# Altium schematic sheet Altium_Schematic.schdoc (part 5 of 6)
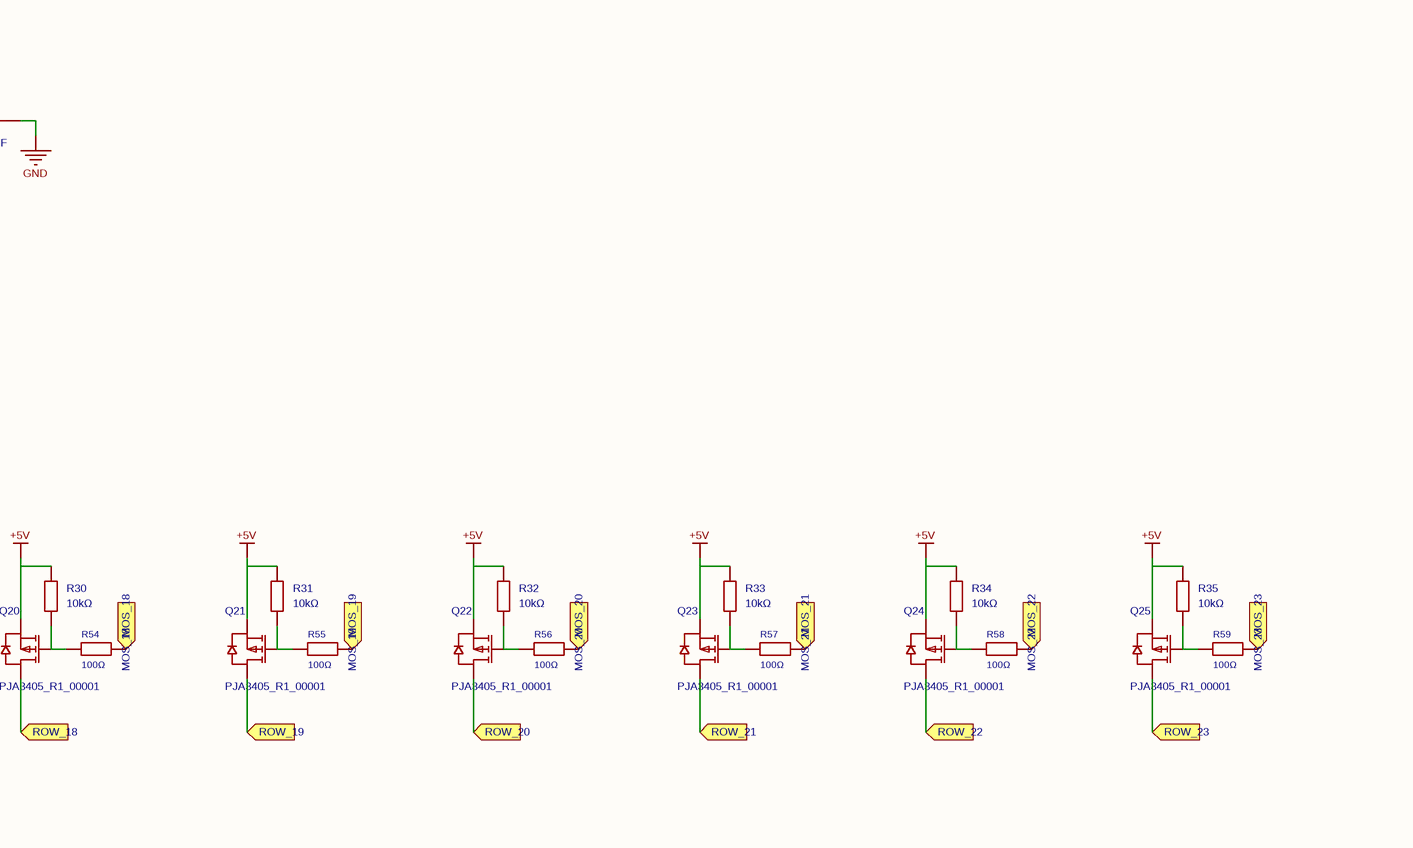
[diagram p15: Altium_Schematic.schdoc, bottom column 4 of 4]
## Nets
+3V3: C1.2 C2.1 C4.1 C5.1 C6.1 C7.1 C8.1 C9.1 C10.1 C11.1 C12.1 C13.1 C18.2 C19.2 R6.1 R7.1 R9.1 U1.24(VCC) U2.24(VCC) U3.24(VCC) U4.24(VCC) U5.24(VCC) U6.3(3V3) U10.2(VOUT) U10.4(VOUT)
+5V: C14.2 C15.2 C16.2 C17.2 C20.2 C21.2 D1.5 Q2.2(S) Q3.2(S) Q4.2(S) Q5.2(S) Q6.2(S) Q7.2(S) Q8.2(S) Q9.2(S) Q10.2(S) Q11.2(S) Q12.2(S) Q13.2(S) Q14.2(S) Q15.2(S) Q16.2(S) Q17.2(S) Q18.2(S) Q19.2(S) Q20.2(S) Q21.2(S) Q22.2(S) Q23.2(S) Q24.2(S) Q25.2(S) R8.1 R12.1 R13.1 R14.1 R15.1 R16.1 R17.1 R18.1 R19.1 R20.1 R21.1 R22.1 R23.1 R24.1 R25.1 R26.1 R27.1 R28.1 R29.1 R30.1 R31.1 R32.1 R33.1 R34.1 R35.1 U7.10(MR#) U7.16(VCC) U8.10(MR#) U8.16(VCC) U9.10(MR#) U9.16(VCC) U10.3(VIN) USB1.A4B9(VBUS) USB1.B4A9(VBUS)
GND: C1.1 C2.2 C3.1 C4.2 C5.2 C6.2 C7.2 C8.2 C9.2 C10.2 C11.2 C12.2 C13.2 C14.1 C15.1 C16.1 C17.1 C18.1 C19.1 C20.1 C21.1 D1.2 H1.3 H2.3 Q1.2(S) R1.1 R2.1 R3.1 R4.1 R5.1 R11.2 R60.1 R61.1 SW1.1 U1.1(GND) U2.1(GND) U3.1(GND) U4.1(GND) U5.1(GND) U6.1(GND) U6.2(GND) U6.11(GND) U6.14(GND) U6.36(GND) U6.37(GND) U6.38(GND) U6.39(GND) U6.40(GND) U6.41(GND) U6.42(GND) U6.43(GND) U6.44(GND) U6.45(GND) U6.46(GND) U6.47(GND) U6.48(GND) U6.49(GND) U6.50(GND) U6.51(GND) U6.52(GND) U6.53(GND) U7.8(GND) U7.17(GND) U8.8(GND) U8.17(GND) U9.8(GND) U9.17(GND) U10.1(GND) USB1.13(EH) USB1.14(EH) USB1.A1B12(GND) USB1.B1A12(GND)
COLUMN_0: U1.5(OUT0)
COLUMN_0: LED1.2(K) LED73.2(K) LED145.2(K) LED217.2(K) LED289.2(K) LED361.2(K) LED433.2(K) LED505.2(K) LED577.2(K) LED649.2(K) LED721.2(K) LED793.2(K) LED865.2(K) LED937.2(K) LED1009.2(K) LED1081.2(K) LED1153.2(K) LED1225.2(K) LED1297.2(K) LED1369.2(K) LED1441.2(K) LED1513.2(K) LED1585.2(K) LED1657.2(K) ; port COLUMN_0  [a separate net that carries the same name]
COLUMN_1: U1.6(OUT1)
COLUMN_1: LED2.2(K) LED74.2(K) LED146.2(K) LED218.2(K) LED290.2(K) LED362.2(K) LED434.2(K) LED506.2(K) LED578.2(K) LED650.2(K) LED722.2(K) LED794.2(K) LED866.2(K) LED938.2(K) LED1010.2(K) LED1082.2(K) LED1154.2(K) LED1226.2(K) LED1298.2(K) LED1370.2(K) LED1442.2(K) LED1514.2(K) LED1586.2(K) LED1658.2(K) ; port COLUMN_1  [a separate net that carries the same name]
COLUMN_2: U1.7(OUT2)
COLUMN_2: LED3.2(K) LED75.2(K) LED147.2(K) LED219.2(K) LED291.2(K) LED363.2(K) LED435.2(K) LED507.2(K) LED579.2(K) LED651.2(K) LED723.2(K) LED795.2(K) LED867.2(K) LED939.2(K) LED1011.2(K) LED1083.2(K) LED1155.2(K) LED1227.2(K) LED1299.2(K) LED1371.2(K) LED1443.2(K) LED1515.2(K) LED1587.2(K) LED1659.2(K) ; port COLUMN_2  [a separate net that carries the same name]
COLUMN_3: U1.8(OUT3)
COLUMN_3: LED4.2(K) LED76.2(K) LED148.2(K) LED220.2(K) LED292.2(K) LED364.2(K) LED436.2(K) LED508.2(K) LED580.2(K) LED652.2(K) LED724.2(K) LED796.2(K) LED868.2(K) LED940.2(K) LED1012.2(K) LED1084.2(K) LED1156.2(K) LED1228.2(K) LED1300.2(K) LED1372.2(K) LED1444.2(K) LED1516.2(K) LED1588.2(K) LED1660.2(K) ; port COLUMN_3  [a separate net that carries the same name]
COLUMN_4: U1.9(OUT4)
COLUMN_4: LED5.2(K) LED77.2(K) LED149.2(K) LED221.2(K) LED293.2(K) LED365.2(K) LED437.2(K) LED509.2(K) LED581.2(K) LED653.2(K) LED725.2(K) LED797.2(K) LED869.2(K) LED941.2(K) LED1013.2(K) LED1085.2(K) LED1157.2(K) LED1229.2(K) LED1301.2(K) LED1373.2(K) LED1445.2(K) LED1517.2(K) LED1589.2(K) LED1661.2(K) ; port COLUMN_4  [a separate net that carries the same name]
COLUMN_5: U1.10(OUT5)
COLUMN_5: LED6.2(K) LED78.2(K) LED150.2(K) LED222.2(K) LED294.2(K) LED366.2(K) LED438.2(K) LED510.2(K) LED582.2(K) LED654.2(K) LED726.2(K) LED798.2(K) LED870.2(K) LED942.2(K) LED1014.2(K) LED1086.2(K) LED1158.2(K) LED1230.2(K) LED1302.2(K) LED1374.2(K) LED1446.2(K) LED1518.2(K) LED1590.2(K) LED1662.2(K) ; port COLUMN_5  [a separate net that carries the same name]
COLUMN_6: U1.11(OUT6)
COLUMN_6: LED7.2(K) LED79.2(K) LED151.2(K) LED223.2(K) LED295.2(K) LED367.2(K) LED439.2(K) LED511.2(K) LED583.2(K) LED655.2(K) LED727.2(K) LED799.2(K) LED871.2(K) LED943.2(K) LED1015.2(K) LED1087.2(K) LED1159.2(K) LED1231.2(K) LED1303.2(K) LED1375.2(K) LED1447.2(K) LED1519.2(K) LED1591.2(K) LED1663.2(K) ; port COLUMN_6  [a separate net that carries the same name]
COLUMN_7: U1.12(OUT7)
COLUMN_7: LED8.2(K) LED80.2(K) LED152.2(K) LED224.2(K) LED296.2(K) LED368.2(K) LED440.2(K) LED512.2(K) LED584.2(K) LED656.2(K) LED728.2(K) LED800.2(K) LED872.2(K) LED944.2(K) LED1016.2(K) LED1088.2(K) LED1160.2(K) LED1232.2(K) LED1304.2(K) LED1376.2(K) LED1448.2(K) LED1520.2(K) LED1592.2(K) LED1664.2(K) ; port COLUMN_7  [a separate net that carries the same name]
COLUMN_8: U1.13(OUT8)
COLUMN_8: LED9.2(K) LED81.2(K) LED153.2(K) LED225.2(K) LED297.2(K) LED369.2(K) LED441.2(K) LED513.2(K) LED585.2(K) LED657.2(K) LED729.2(K) LED801.2(K) LED873.2(K) LED945.2(K) LED1017.2(K) LED1089.2(K) LED1161.2(K) LED1233.2(K) LED1305.2(K) LED1377.2(K) LED1449.2(K) LED1521.2(K) LED1593.2(K) LED1665.2(K) ; port COLUMN_8  [a separate net that carries the same name]
COLUMN_9: U1.14(OUT9)
COLUMN_9: LED10.2(K) LED82.2(K) LED154.2(K) LED226.2(K) LED298.2(K) LED370.2(K) LED442.2(K) LED514.2(K) LED586.2(K) LED658.2(K) LED730.2(K) LED802.2(K) LED874.2(K) LED946.2(K) LED1018.2(K) LED1090.2(K) LED1162.2(K) LED1234.2(K) LED1306.2(K) LED1378.2(K) LED1450.2(K) LED1522.2(K) LED1594.2(K) LED1666.2(K) ; port COLUMN_9  [a separate net that carries the same name]
COLUMN_10: U1.15(OUT10)
COLUMN_10: LED11.2(K) LED83.2(K) LED155.2(K) LED227.2(K) LED299.2(K) LED371.2(K) LED443.2(K) LED515.2(K) LED587.2(K) LED659.2(K) LED731.2(K) LED803.2(K) LED875.2(K) LED947.2(K) LED1019.2(K) LED1091.2(K) LED1163.2(K) LED1235.2(K) LED1307.2(K) LED1379.2(K) LED1451.2(K) LED1523.2(K) LED1595.2(K) LED1667.2(K) ; port COLUMN_10  [a separate net that carries the same name]
COLUMN_11: U1.16(OUT11)
COLUMN_11: LED12.2(K) LED84.2(K) LED156.2(K) LED228.2(K) LED300.2(K) LED372.2(K) LED444.2(K) LED516.2(K) LED588.2(K) LED660.2(K) LED732.2(K) LED804.2(K) LED876.2(K) LED948.2(K) LED1020.2(K) LED1092.2(K) LED1164.2(K) LED1236.2(K) LED1308.2(K) LED1380.2(K) LED1452.2(K) LED1524.2(K) LED1596.2(K) LED1668.2(K) ; port COLUMN_11  [a separate net that carries the same name]
COLUMN_12: U1.17(OUT12)
COLUMN_12: LED13.2(K) LED85.2(K) LED157.2(K) LED229.2(K) LED301.2(K) LED373.2(K) LED445.2(K) LED517.2(K) LED589.2(K) LED661.2(K) LED733.2(K) LED805.2(K) LED877.2(K) LED949.2(K) LED1021.2(K) LED1093.2(K) LED1165.2(K) LED1237.2(K) LED1309.2(K) LED1381.2(K) LED1453.2(K) LED1525.2(K) LED1597.2(K) LED1669.2(K) ; port COLUMN_12  [a separate net that carries the same name]
COLUMN_13: U1.18(OUT13)
COLUMN_13: LED14.2(K) LED86.2(K) LED158.2(K) LED230.2(K) LED302.2(K) LED374.2(K) LED446.2(K) LED518.2(K) LED590.2(K) LED662.2(K) LED734.2(K) LED806.2(K) LED878.2(K) LED950.2(K) LED1022.2(K) LED1094.2(K) LED1166.2(K) LED1238.2(K) LED1310.2(K) LED1382.2(K) LED1454.2(K) LED1526.2(K) LED1598.2(K) LED1670.2(K) ; port COLUMN_13  [a separate net that carries the same name]
COLUMN_14: U1.19(OUT14)
COLUMN_14: LED15.2(K) LED87.2(K) LED159.2(K) LED231.2(K) LED303.2(K) LED375.2(K) LED447.2(K) LED519.2(K) LED591.2(K) LED663.2(K) LED735.2(K) LED807.2(K) LED879.2(K) LED951.2(K) LED1023.2(K) LED1095.2(K) LED1167.2(K) LED1239.2(K) LED1311.2(K) LED1383.2(K) LED1455.2(K) LED1527.2(K) LED1599.2(K) LED1671.2(K) ; port COLUMN_14  [a separate net that carries the same name]
COLUMN_15: U1.20(OUT15)
COLUMN_15: LED16.2(K) LED88.2(K) LED160.2(K) LED232.2(K) LED304.2(K) LED376.2(K) LED448.2(K) LED520.2(K) LED592.2(K) LED664.2(K) LED736.2(K) LED808.2(K) LED880.2(K) LED952.2(K) LED1024.2(K) LED1096.2(K) LED1168.2(K) LED1240.2(K) LED1312.2(K) LED1384.2(K) LED1456.2(K) LED1528.2(K) LED1600.2(K) LED1672.2(K) ; port COLUMN_15  [a separate net that carries the same name]
COLUMN_16: U2.5(OUT0)
COLUMN_16: LED17.2(K) LED89.2(K) LED161.2(K) LED233.2(K) LED305.2(K) LED377.2(K) LED449.2(K) LED521.2(K) LED593.2(K) LED665.2(K) LED737.2(K) LED809.2(K) LED881.2(K) LED953.2(K) LED1025.2(K) LED1097.2(K) LED1169.2(K) LED1241.2(K) LED1313.2(K) LED1385.2(K) LED1457.2(K) LED1529.2(K) LED1601.2(K) LED1673.2(K) ; port COLUMN_16  [a separate net that carries the same name]
COLUMN_17: U2.6(OUT1)
COLUMN_17: LED18.2(K) LED90.2(K) LED162.2(K) LED234.2(K) LED306.2(K) LED378.2(K) LED450.2(K) LED522.2(K) LED594.2(K) LED666.2(K) LED738.2(K) LED810.2(K) LED882.2(K) LED954.2(K) LED1026.2(K) LED1098.2(K) LED1170.2(K) LED1242.2(K) LED1314.2(K) LED1386.2(K) LED1458.2(K) LED1530.2(K) LED1602.2(K) LED1674.2(K) ; port COLUMN_17  [a separate net that carries the same name]
COLUMN_18: U2.7(OUT2)
COLUMN_18: LED19.2(K) LED91.2(K) LED163.2(K) LED235.2(K) LED307.2(K) LED379.2(K) LED451.2(K) LED523.2(K) LED595.2(K) LED667.2(K) LED739.2(K) LED811.2(K) LED883.2(K) LED955.2(K) LED1027.2(K) LED1099.2(K) LED1171.2(K) LED1243.2(K) LED1315.2(K) LED1387.2(K) LED1459.2(K) LED1531.2(K) LED1603.2(K) LED1675.2(K) ; port COLUMN_18  [a separate net that carries the same name]
COLUMN_19: U2.8(OUT3)
COLUMN_19: LED20.2(K) LED92.2(K) LED164.2(K) LED236.2(K) LED308.2(K) LED380.2(K) LED452.2(K) LED524.2(K) LED596.2(K) LED668.2(K) LED740.2(K) LED812.2(K) LED884.2(K) LED956.2(K) LED1028.2(K) LED1100.2(K) LED1172.2(K) LED1244.2(K) LED1316.2(K) LED1388.2(K) LED1460.2(K) LED1532.2(K) LED1604.2(K) LED1676.2(K) ; port COLUMN_19  [a separate net that carries the same name]
COLUMN_20: U2.9(OUT4)
COLUMN_20: LED21.2(K) LED93.2(K) LED165.2(K) LED237.2(K) LED309.2(K) LED381.2(K) LED453.2(K) LED525.2(K) LED597.2(K) LED669.2(K) LED741.2(K) LED813.2(K) LED885.2(K) LED957.2(K) LED1029.2(K) LED1101.2(K) LED1173.2(K) LED1245.2(K) LED1317.2(K) LED1389.2(K) LED1461.2(K) LED1533.2(K) LED1605.2(K) LED1677.2(K) ; port COLUMN_20  [a separate net that carries the same name]
COLUMN_21: U2.10(OUT5)
COLUMN_21: LED22.2(K) LED94.2(K) LED166.2(K) LED238.2(K) LED310.2(K) LED382.2(K) LED454.2(K) LED526.2(K) LED598.2(K) LED670.2(K) LED742.2(K) LED814.2(K) LED886.2(K) LED958.2(K) LED1030.2(K) LED1102.2(K) LED1174.2(K) LED1246.2(K) LED1318.2(K) LED1390.2(K) LED1462.2(K) LED1534.2(K) LED1606.2(K) LED1678.2(K) ; port COLUMN_21  [a separate net that carries the same name]
COLUMN_22: U2.11(OUT6)
COLUMN_22: LED23.2(K) LED95.2(K) LED167.2(K) LED239.2(K) LED311.2(K) LED383.2(K) LED455.2(K) LED527.2(K) LED599.2(K) LED671.2(K) LED743.2(K) LED815.2(K) LED887.2(K) LED959.2(K) LED1031.2(K) LED1103.2(K) LED1175.2(K) LED1247.2(K) LED1319.2(K) LED1391.2(K) LED1463.2(K) LED1535.2(K) LED1607.2(K) LED1679.2(K) ; port COLUMN_22  [a separate net that carries the same name]
COLUMN_23: U2.12(OUT7)
COLUMN_23: LED24.2(K) LED96.2(K) LED168.2(K) LED240.2(K) LED312.2(K) LED384.2(K) LED456.2(K) LED528.2(K) LED600.2(K) LED672.2(K) LED744.2(K) LED816.2(K) LED888.2(K) LED960.2(K) LED1032.2(K) LED1104.2(K) LED1176.2(K) LED1248.2(K) LED1320.2(K) LED1392.2(K) LED1464.2(K) LED1536.2(K) LED1608.2(K) LED1680.2(K) ; port COLUMN_23  [a separate net that carries the same name]
COLUMN_24: U2.13(OUT8)
COLUMN_24: LED25.2(K) LED97.2(K) LED169.2(K) LED241.2(K) LED313.2(K) LED385.2(K) LED457.2(K) LED529.2(K) LED601.2(K) LED673.2(K) LED745.2(K) LED817.2(K) LED889.2(K) LED961.2(K) LED1033.2(K) LED1105.2(K) LED1177.2(K) LED1249.2(K) LED1321.2(K) LED1393.2(K) LED1465.2(K) LED1537.2(K) LED1609.2(K) LED1681.2(K) ; port COLUMN_24  [a separate net that carries the same name]
COLUMN_25: U2.14(OUT9)
COLUMN_25: LED26.2(K) LED98.2(K) LED170.2(K) LED242.2(K) LED314.2(K) LED386.2(K) LED458.2(K) LED530.2(K) LED602.2(K) LED674.2(K) LED746.2(K) LED818.2(K) LED890.2(K) LED962.2(K) LED1034.2(K) LED1106.2(K) LED1178.2(K) LED1250.2(K) LED1322.2(K) LED1394.2(K) LED1466.2(K) LED1538.2(K) LED1610.2(K) LED1682.2(K) ; port COLUMN_25  [a separate net that carries the same name]
COLUMN_26: U2.15(OUT10)
COLUMN_26: LED27.2(K) LED99.2(K) LED171.2(K) LED243.2(K) LED315.2(K) LED387.2(K) LED459.2(K) LED531.2(K) LED603.2(K) LED675.2(K) LED747.2(K) LED819.2(K) LED891.2(K) LED963.2(K) LED1035.2(K) LED1107.2(K) LED1179.2(K) LED1251.2(K) LED1323.2(K) LED1395.2(K) LED1467.2(K) LED1539.2(K) LED1611.2(K) LED1683.2(K) ; port COLUMN_26  [a separate net that carries the same name]
COLUMN_27: U2.16(OUT11)
COLUMN_27: LED28.2(K) LED100.2(K) LED172.2(K) LED244.2(K) LED316.2(K) LED388.2(K) LED460.2(K) LED532.2(K) LED604.2(K) LED676.2(K) LED748.2(K) LED820.2(K) LED892.2(K) LED964.2(K) LED1036.2(K) LED1108.2(K) LED1180.2(K) LED1252.2(K) LED1324.2(K) LED1396.2(K) LED1468.2(K) LED1540.2(K) LED1612.2(K) LED1684.2(K) ; port COLUMN_27  [a separate net that carries the same name]
COLUMN_28: U2.17(OUT12)
COLUMN_28: LED29.2(K) LED101.2(K) LED173.2(K) LED245.2(K) LED317.2(K) LED389.2(K) LED461.2(K) LED533.2(K) LED605.2(K) LED677.2(K) LED749.2(K) LED821.2(K) LED893.2(K) LED965.2(K) LED1037.2(K) LED1109.2(K) LED1181.2(K) LED1253.2(K) LED1325.2(K) LED1397.2(K) LED1469.2(K) LED1541.2(K) LED1613.2(K) LED1685.2(K) ; port COLUMN_28  [a separate net that carries the same name]
COLUMN_29: U2.18(OUT13)
COLUMN_29: LED30.2(K) LED102.2(K) LED174.2(K) LED246.2(K) LED318.2(K) LED390.2(K) LED462.2(K) LED534.2(K) LED606.2(K) LED678.2(K) LED750.2(K) LED822.2(K) LED894.2(K) LED966.2(K) LED1038.2(K) LED1110.2(K) LED1182.2(K) LED1254.2(K) LED1326.2(K) LED1398.2(K) LED1470.2(K) LED1542.2(K) LED1614.2(K) LED1686.2(K) ; port COLUMN_29  [a separate net that carries the same name]
COLUMN_30: U2.19(OUT14)
COLUMN_30: LED31.2(K) LED103.2(K) LED175.2(K) LED247.2(K) LED319.2(K) LED391.2(K) LED463.2(K) LED535.2(K) LED607.2(K) LED679.2(K) LED751.2(K) LED823.2(K) LED895.2(K) LED967.2(K) LED1039.2(K) LED1111.2(K) LED1183.2(K) LED1255.2(K) LED1327.2(K) LED1399.2(K) LED1471.2(K) LED1543.2(K) LED1615.2(K) LED1687.2(K) ; port COLUMN_30  [a separate net that carries the same name]
COLUMN_31: U2.20(OUT15)
COLUMN_31: LED32.2(K) LED104.2(K) LED176.2(K) LED248.2(K) LED320.2(K) LED392.2(K) LED464.2(K) LED536.2(K) LED608.2(K) LED680.2(K) LED752.2(K) LED824.2(K) LED896.2(K) LED968.2(K) LED1040.2(K) LED1112.2(K) LED1184.2(K) LED1256.2(K) LED1328.2(K) LED1400.2(K) LED1472.2(K) LED1544.2(K) LED1616.2(K) LED1688.2(K) ; port COLUMN_31  [a separate net that carries the same name]
COLUMN_32: U3.5(OUT0)
COLUMN_32: LED33.2(K) LED105.2(K) LED177.2(K) LED249.2(K) LED321.2(K) LED393.2(K) LED465.2(K) LED537.2(K) LED609.2(K) LED681.2(K) LED753.2(K) LED825.2(K) LED897.2(K) LED969.2(K) LED1041.2(K) LED1113.2(K) LED1185.2(K) LED1257.2(K) LED1329.2(K) LED1401.2(K) LED1473.2(K) LED1545.2(K) LED1617.2(K) LED1689.2(K) ; port COLUMN_32  [a separate net that carries the same name]
COLUMN_33: U3.6(OUT1)
COLUMN_33: LED34.2(K) LED106.2(K) LED178.2(K) LED250.2(K) LED322.2(K) LED394.2(K) LED466.2(K) LED538.2(K) LED610.2(K) LED682.2(K) LED754.2(K) LED826.2(K) LED898.2(K) LED970.2(K) LED1042.2(K) LED1114.2(K) LED1186.2(K) LED1258.2(K) LED1330.2(K) LED1402.2(K) LED1474.2(K) LED1546.2(K) LED1618.2(K) LED1690.2(K) ; port COLUMN_33  [a separate net that carries the same name]
COLUMN_34: U3.7(OUT2)
COLUMN_34: LED35.2(K) LED107.2(K) LED179.2(K) LED251.2(K) LED323.2(K) LED395.2(K) LED467.2(K) LED539.2(K) LED611.2(K) LED683.2(K) LED755.2(K) LED827.2(K) LED899.2(K) LED971.2(K) LED1043.2(K) LED1115.2(K) LED1187.2(K) LED1259.2(K) LED1331.2(K) LED1403.2(K) LED1475.2(K) LED1547.2(K) LED1619.2(K) LED1691.2(K) ; port COLUMN_34  [a separate net that carries the same name]
COLUMN_35: U3.8(OUT3)
COLUMN_35: LED36.2(K) LED108.2(K) LED180.2(K) LED252.2(K) LED324.2(K) LED396.2(K) LED468.2(K) LED540.2(K) LED612.2(K) LED684.2(K) LED756.2(K) LED828.2(K) LED900.2(K) LED972.2(K) LED1044.2(K) LED1116.2(K) LED1188.2(K) LED1260.2(K) LED1332.2(K) LED1404.2(K) LED1476.2(K) LED1548.2(K) LED1620.2(K) LED1692.2(K) ; port COLUMN_35  [a separate net that carries the same name]
COLUMN_36: U3.9(OUT4)
COLUMN_36: LED37.2(K) LED109.2(K) LED181.2(K) LED253.2(K) LED325.2(K) LED397.2(K) LED469.2(K) LED541.2(K) LED613.2(K) LED685.2(K) LED757.2(K) LED829.2(K) LED901.2(K) LED973.2(K) LED1045.2(K) LED1117.2(K) LED1189.2(K) LED1261.2(K) LED1333.2(K) LED1405.2(K) LED1477.2(K) LED1549.2(K) LED1621.2(K) LED1693.2(K) ; port COLUMN_36  [a separate net that carries the same name]
COLUMN_37: U3.10(OUT5)
COLUMN_37: LED38.2(K) LED110.2(K) LED182.2(K) LED254.2(K) LED326.2(K) LED398.2(K) LED470.2(K) LED542.2(K) LED614.2(K) LED686.2(K) LED758.2(K) LED830.2(K) LED902.2(K) LED974.2(K) LED1046.2(K) LED1118.2(K) LED1190.2(K) LED1262.2(K) LED1334.2(K) LED1406.2(K) LED1478.2(K) LED1550.2(K) LED1622.2(K) LED1694.2(K) ; port COLUMN_37  [a separate net that carries the same name]
COLUMN_38: U3.11(OUT6)
COLUMN_38: LED39.2(K) LED111.2(K) LED183.2(K) LED255.2(K) LED327.2(K) LED399.2(K) LED471.2(K) LED543.2(K) LED615.2(K) LED687.2(K) LED759.2(K) LED831.2(K) LED903.2(K) LED975.2(K) LED1047.2(K) LED1119.2(K) LED1191.2(K) LED1263.2(K) LED1335.2(K) LED1407.2(K) LED1479.2(K) LED1551.2(K) LED1623.2(K) LED1695.2(K) ; port COLUMN_38  [a separate net that carries the same name]
COLUMN_39: U3.12(OUT7)
COLUMN_39: LED40.2(K) LED112.2(K) LED184.2(K) LED256.2(K) LED328.2(K) LED400.2(K) LED472.2(K) LED544.2(K) LED616.2(K) LED688.2(K) LED760.2(K) LED832.2(K) LED904.2(K) LED976.2(K) LED1048.2(K) LED1120.2(K) LED1192.2(K) LED1264.2(K) LED1336.2(K) LED1408.2(K) LED1480.2(K) LED1552.2(K) LED1624.2(K) LED1696.2(K) ; port COLUMN_39  [a separate net that carries the same name]
COLUMN_40: U3.13(OUT8)
COLUMN_40: LED41.2(K) LED113.2(K) LED185.2(K) LED257.2(K) LED329.2(K) LED401.2(K) LED473.2(K) LED545.2(K) LED617.2(K) LED689.2(K) LED761.2(K) LED833.2(K) LED905.2(K) LED977.2(K) LED1049.2(K) LED1121.2(K) LED1193.2(K) LED1265.2(K) LED1337.2(K) LED1409.2(K) LED1481.2(K) LED1553.2(K) LED1625.2(K) LED1697.2(K) ; port COLUMN_40  [a separate net that carries the same name]
COLUMN_41: U3.14(OUT9)
COLUMN_41: LED42.2(K) LED114.2(K) LED186.2(K) LED258.2(K) LED330.2(K) LED402.2(K) LED474.2(K) LED546.2(K) LED618.2(K) LED690.2(K) LED762.2(K) LED834.2(K) LED906.2(K) LED978.2(K) LED1050.2(K) LED1122.2(K) LED1194.2(K) LED1266.2(K) LED1338.2(K) LED1410.2(K) LED1482.2(K) LED1554.2(K) LED1626.2(K) LED1698.2(K) ; port COLUMN_41  [a separate net that carries the same name]
COLUMN_42: U3.15(OUT10)
COLUMN_42: LED43.2(K) LED115.2(K) LED187.2(K) LED259.2(K) LED331.2(K) LED403.2(K) LED475.2(K) LED547.2(K) LED619.2(K) LED691.2(K) LED763.2(K) LED835.2(K) LED907.2(K) LED979.2(K) LED1051.2(K) LED1123.2(K) LED1195.2(K) LED1267.2(K) LED1339.2(K) LED1411.2(K) LED1483.2(K) LED1555.2(K) LED1627.2(K) LED1699.2(K) ; port COLUMN_42  [a separate net that carries the same name]
COLUMN_43: U3.16(OUT11)
COLUMN_43: LED44.2(K) LED116.2(K) LED188.2(K) LED260.2(K) LED332.2(K) LED404.2(K) LED476.2(K) LED548.2(K) LED620.2(K) LED692.2(K) LED764.2(K) LED836.2(K) LED908.2(K) LED980.2(K) LED1052.2(K) LED1124.2(K) LED1196.2(K) LED1268.2(K) LED1340.2(K) LED1412.2(K) LED1484.2(K) LED1556.2(K) LED1628.2(K) LED1700.2(K) ; port COLUMN_43  [a separate net that carries the same name]
COLUMN_44: U3.17(OUT12)
COLUMN_44: LED45.2(K) LED117.2(K) LED189.2(K) LED261.2(K) LED333.2(K) LED405.2(K) LED477.2(K) LED549.2(K) LED621.2(K) LED693.2(K) LED765.2(K) LED837.2(K) LED909.2(K) LED981.2(K) LED1053.2(K) LED1125.2(K) LED1197.2(K) LED1269.2(K) LED1341.2(K) LED1413.2(K) LED1485.2(K) LED1557.2(K) LED1629.2(K) LED1701.2(K) ; port COLUMN_44  [a separate net that carries the same name]
COLUMN_45: U3.18(OUT13)
COLUMN_45: LED46.2(K) LED118.2(K) LED190.2(K) LED262.2(K) LED334.2(K) LED406.2(K) LED478.2(K) LED550.2(K) LED622.2(K) LED694.2(K) LED766.2(K) LED838.2(K) LED910.2(K) LED982.2(K) LED1054.2(K) LED1126.2(K) LED1198.2(K) LED1270.2(K) LED1342.2(K) LED1414.2(K) LED1486.2(K) LED1558.2(K) LED1630.2(K) LED1702.2(K) ; port COLUMN_45  [a separate net that carries the same name]
COLUMN_46: U3.19(OUT14)
COLUMN_46: LED47.2(K) LED119.2(K) LED191.2(K) LED263.2(K) LED335.2(K) LED407.2(K) LED479.2(K) LED551.2(K) LED623.2(K) LED695.2(K) LED767.2(K) LED839.2(K) LED911.2(K) LED983.2(K) LED1055.2(K) LED1127.2(K) LED1199.2(K) LED1271.2(K) LED1343.2(K) LED1415.2(K) LED1487.2(K) LED1559.2(K) LED1631.2(K) LED1703.2(K) ; port COLUMN_46  [a separate net that carries the same name]
COLUMN_47: U3.20(OUT15)
COLUMN_47: LED48.2(K) LED120.2(K) LED192.2(K) LED264.2(K) LED336.2(K) LED408.2(K) LED480.2(K) LED552.2(K) LED624.2(K) LED696.2(K) LED768.2(K) LED840.2(K) LED912.2(K) LED984.2(K) LED1056.2(K) LED1128.2(K) LED1200.2(K) LED1272.2(K) LED1344.2(K) LED1416.2(K) LED1488.2(K) LED1560.2(K) LED1632.2(K) LED1704.2(K) ; port COLUMN_47  [a separate net that carries the same name]
COLUMN_48: U4.5(OUT0)
COLUMN_48: LED49.2(K) LED121.2(K) LED193.2(K) LED265.2(K) LED337.2(K) LED409.2(K) LED481.2(K) LED553.2(K) LED625.2(K) LED697.2(K) LED769.2(K) LED841.2(K) LED913.2(K) LED985.2(K) LED1057.2(K) LED1129.2(K) LED1201.2(K) LED1273.2(K) LED1345.2(K) LED1417.2(K) LED1489.2(K) LED1561.2(K) LED1633.2(K) LED1705.2(K) ; port COLUMN_48  [a separate net that carries the same name]
COLUMN_49: U4.6(OUT1)
COLUMN_49: LED50.2(K) LED122.2(K) LED194.2(K) LED266.2(K) LED338.2(K) LED410.2(K) LED482.2(K) LED554.2(K) LED626.2(K) LED698.2(K) LED770.2(K) LED842.2(K) LED914.2(K) LED986.2(K) LED1058.2(K) LED1130.2(K) LED1202.2(K) LED1274.2(K) LED1346.2(K) LED1418.2(K) LED1490.2(K) LED1562.2(K) LED1634.2(K) LED1706.2(K) ; port COLUMN_49  [a separate net that carries the same name]
COLUMN_50: U4.7(OUT2)
COLUMN_50: LED51.2(K) LED123.2(K) LED195.2(K) LED267.2(K) LED339.2(K) LED411.2(K) LED483.2(K) LED555.2(K) LED627.2(K) LED699.2(K) LED771.2(K) LED843.2(K) LED915.2(K) LED987.2(K) LED1059.2(K) LED1131.2(K) LED1203.2(K) LED1275.2(K) LED1347.2(K) LED1419.2(K) LED1491.2(K) LED1563.2(K) LED1635.2(K) LED1707.2(K) ; port COLUMN_50  [a separate net that carries the same name]
COLUMN_51: U4.8(OUT3)
COLUMN_51: LED52.2(K) LED124.2(K) LED196.2(K) LED268.2(K) LED340.2(K) LED412.2(K) LED484.2(K) LED556.2(K) LED628.2(K) LED700.2(K) LED772.2(K) LED844.2(K) LED916.2(K) LED988.2(K) LED1060.2(K) LED1132.2(K) LED1204.2(K) LED1276.2(K) LED1348.2(K) LED1420.2(K) LED1492.2(K) LED1564.2(K) LED1636.2(K) LED1708.2(K) ; port COLUMN_51  [a separate net that carries the same name]
COLUMN_52: U4.9(OUT4)
COLUMN_52: LED53.2(K) LED125.2(K) LED197.2(K) LED269.2(K) LED341.2(K) LED413.2(K) LED485.2(K) LED557.2(K) LED629.2(K) LED701.2(K) LED773.2(K) LED845.2(K) LED917.2(K) LED989.2(K) LED1061.2(K) LED1133.2(K) LED1205.2(K) LED1277.2(K) LED1349.2(K) LED1421.2(K) LED1493.2(K) LED1565.2(K) LED1637.2(K) LED1709.2(K) ; port COLUMN_52  [a separate net that carries the same name]
COLUMN_53: U4.10(OUT5)
COLUMN_53: LED54.2(K) LED126.2(K) LED198.2(K) LED270.2(K) LED342.2(K) LED414.2(K) LED486.2(K) LED558.2(K) LED630.2(K) LED702.2(K) LED774.2(K) LED846.2(K) LED918.2(K) LED990.2(K) LED1062.2(K) LED1134.2(K) LED1206.2(K) LED1278.2(K) LED1350.2(K) LED1422.2(K) LED1494.2(K) LED1566.2(K) LED1638.2(K) LED1710.2(K) ; port COLUMN_53  [a separate net that carries the same name]
COLUMN_54: U4.11(OUT6)
COLUMN_54: LED55.2(K) LED127.2(K) LED199.2(K) LED271.2(K) LED343.2(K) LED415.2(K) LED487.2(K) LED559.2(K) LED631.2(K) LED703.2(K) LED775.2(K) LED847.2(K) LED919.2(K) LED991.2(K) LED1063.2(K) LED1135.2(K) LED1207.2(K) LED1279.2(K) LED1351.2(K) LED1423.2(K) LED1495.2(K) LED1567.2(K) LED1639.2(K) LED1711.2(K) ; port COLUMN_54  [a separate net that carries the same name]
COLUMN_55: U4.12(OUT7)
COLUMN_55: LED56.2(K) LED128.2(K) LED200.2(K) LED272.2(K) LED344.2(K) LED416.2(K) LED488.2(K) LED560.2(K) LED632.2(K) LED704.2(K) LED776.2(K) LED848.2(K) LED920.2(K) LED992.2(K) LED1064.2(K) LED1136.2(K) LED1208.2(K) LED1280.2(K) LED1352.2(K) LED1424.2(K) LED1496.2(K) LED1568.2(K) LED1640.2(K) LED1712.2(K) ; port COLUMN_55  [a separate net that carries the same name]
COLUMN_56: U4.13(OUT8)
COLUMN_56: LED57.2(K) LED129.2(K) LED201.2(K) LED273.2(K) LED345.2(K) LED417.2(K) LED489.2(K) LED561.2(K) LED633.2(K) LED705.2(K) LED777.2(K) LED849.2(K) LED921.2(K) LED993.2(K) LED1065.2(K) LED1137.2(K) LED1209.2(K) LED1281.2(K) LED1353.2(K) LED1425.2(K) LED1497.2(K) LED1569.2(K) LED1641.2(K) LED1713.2(K) ; port COLUMN_56  [a separate net that carries the same name]
COLUMN_57: U4.14(OUT9)
COLUMN_57: LED58.2(K) LED130.2(K) LED202.2(K) LED274.2(K) LED346.2(K) LED418.2(K) LED490.2(K) LED562.2(K) LED634.2(K) LED706.2(K) LED778.2(K) LED850.2(K) LED922.2(K) LED994.2(K) LED1066.2(K) LED1138.2(K) LED1210.2(K) LED1282.2(K) LED1354.2(K) LED1426.2(K) LED1498.2(K) LED1570.2(K) LED1642.2(K) LED1714.2(K) ; port COLUMN_57  [a separate net that carries the same name]
COLUMN_58: U4.15(OUT10)
COLUMN_58: LED59.2(K) LED131.2(K) LED203.2(K) LED275.2(K) LED347.2(K) LED419.2(K) LED491.2(K) LED563.2(K) LED635.2(K) LED707.2(K) LED779.2(K) LED851.2(K) LED923.2(K) LED995.2(K) LED1067.2(K) LED1139.2(K) LED1211.2(K) LED1283.2(K) LED1355.2(K) LED1427.2(K) LED1499.2(K) LED1571.2(K) LED1643.2(K) LED1715.2(K) ; port COLUMN_58  [a separate net that carries the same name]
COLUMN_59: U4.16(OUT11)
COLUMN_59: LED60.2(K) LED132.2(K) LED204.2(K) LED276.2(K) LED348.2(K) LED420.2(K) LED492.2(K) LED564.2(K) LED636.2(K) LED708.2(K) LED780.2(K) LED852.2(K) LED924.2(K) LED996.2(K) LED1068.2(K) LED1140.2(K) LED1212.2(K) LED1284.2(K) LED1356.2(K) LED1428.2(K) LED1500.2(K) LED1572.2(K) LED1644.2(K) LED1716.2(K) ; port COLUMN_59  [a separate net that carries the same name]
COLUMN_60: U4.17(OUT12)
COLUMN_60: LED61.2(K) LED133.2(K) LED205.2(K) LED277.2(K) LED349.2(K) LED421.2(K) LED493.2(K) LED565.2(K) LED637.2(K) LED709.2(K) LED781.2(K) LED853.2(K) LED925.2(K) LED997.2(K) LED1069.2(K) LED1141.2(K) LED1213.2(K) LED1285.2(K) LED1357.2(K) LED1429.2(K) LED1501.2(K) LED1573.2(K) LED1645.2(K) LED1717.2(K) ; port COLUMN_60  [a separate net that carries the same name]
COLUMN_61: U4.18(OUT13)
COLUMN_61: LED62.2(K) LED134.2(K) LED206.2(K) LED278.2(K) LED350.2(K) LED422.2(K) LED494.2(K) LED566.2(K) LED638.2(K) LED710.2(K) LED782.2(K) LED854.2(K) LED926.2(K) LED998.2(K) LED1070.2(K) LED1142.2(K) LED1214.2(K) LED1286.2(K) LED1358.2(K) LED1430.2(K) LED1502.2(K) LED1574.2(K) LED1646.2(K) LED1718.2(K) ; port COLUMN_61  [a separate net that carries the same name]
COLUMN_62: U4.19(OUT14)
COLUMN_62: LED63.2(K) LED135.2(K) LED207.2(K) LED279.2(K) LED351.2(K) LED423.2(K) LED495.2(K) LED567.2(K) LED639.2(K) LED711.2(K) LED783.2(K) LED855.2(K) LED927.2(K) LED999.2(K) LED1071.2(K) LED1143.2(K) LED1215.2(K) LED1287.2(K) LED1359.2(K) LED1431.2(K) LED1503.2(K) LED1575.2(K) LED1647.2(K) LED1719.2(K) ; port COLUMN_62  [a separate net that carries the same name]
COLUMN_63: U4.20(OUT15)
COLUMN_63: LED64.2(K) LED136.2(K) LED208.2(K) LED280.2(K) LED352.2(K) LED424.2(K) LED496.2(K) LED568.2(K) LED640.2(K) LED712.2(K) LED784.2(K) LED856.2(K) LED928.2(K) LED1000.2(K) LED1072.2(K) LED1144.2(K) LED1216.2(K) LED1288.2(K) LED1360.2(K) LED1432.2(K) LED1504.2(K) LED1576.2(K) LED1648.2(K) LED1720.2(K) ; port COLUMN_63  [a separate net that carries the same name]
COLUMN_64: U5.5(OUT0)
COLUMN_64: LED65.2(K) LED137.2(K) LED209.2(K) LED281.2(K) LED353.2(K) LED425.2(K) LED497.2(K) LED569.2(K) LED641.2(K) LED713.2(K) LED785.2(K) LED857.2(K) LED929.2(K) LED1001.2(K) LED1073.2(K) LED1145.2(K) LED1217.2(K) LED1289.2(K) LED1361.2(K) LED1433.2(K) LED1505.2(K) LED1577.2(K) LED1649.2(K) LED1721.2(K) ; port COLUMN_64  [a separate net that carries the same name]
COLUMN_65: U5.6(OUT1)
COLUMN_65: LED66.2(K) LED138.2(K) LED210.2(K) LED282.2(K) LED354.2(K) LED426.2(K) LED498.2(K) LED570.2(K) LED642.2(K) LED714.2(K) LED786.2(K) LED858.2(K) LED930.2(K) LED1002.2(K) LED1074.2(K) LED1146.2(K) LED1218.2(K) LED1290.2(K) LED1362.2(K) LED1434.2(K) LED1506.2(K) LED1578.2(K) LED1650.2(K) LED1722.2(K) ; port COLUMN_65  [a separate net that carries the same name]
COLUMN_66: U5.7(OUT2)
COLUMN_66: LED67.2(K) LED139.2(K) LED211.2(K) LED283.2(K) LED355.2(K) LED427.2(K) LED499.2(K) LED571.2(K) LED643.2(K) LED715.2(K) LED787.2(K) LED859.2(K) LED931.2(K) LED1003.2(K) LED1075.2(K) LED1147.2(K) LED1219.2(K) LED1291.2(K) LED1363.2(K) LED1435.2(K) LED1507.2(K) LED1579.2(K) LED1651.2(K) LED1723.2(K) ; port COLUMN_66  [a separate net that carries the same name]
COLUMN_67: U5.8(OUT3)
COLUMN_67: LED68.2(K) LED140.2(K) LED212.2(K) LED284.2(K) LED356.2(K) LED428.2(K) LED500.2(K) LED572.2(K) LED644.2(K) LED716.2(K) LED788.2(K) LED860.2(K) LED932.2(K) LED1004.2(K) LED1076.2(K) LED1148.2(K) LED1220.2(K) LED1292.2(K) LED1364.2(K) LED1436.2(K) LED1508.2(K) LED1580.2(K) LED1652.2(K) LED1724.2(K) ; port COLUMN_67  [a separate net that carries the same name]
COLUMN_68: U5.9(OUT4)
COLUMN_68: LED69.2(K) LED141.2(K) LED213.2(K) LED285.2(K) LED357.2(K) LED429.2(K) LED501.2(K) LED573.2(K) LED645.2(K) LED717.2(K) LED789.2(K) LED861.2(K) LED933.2(K) LED1005.2(K) LED1077.2(K) LED1149.2(K) LED1221.2(K) LED1293.2(K) LED1365.2(K) LED1437.2(K) LED1509.2(K) LED1581.2(K) LED1653.2(K) LED1725.2(K) ; port COLUMN_68  [a separate net that carries the same name]
COLUMN_69: U5.10(OUT5)
COLUMN_69: LED70.2(K) LED142.2(K) LED214.2(K) LED286.2(K) LED358.2(K) LED430.2(K) LED502.2(K) LED574.2(K) LED646.2(K) LED718.2(K) LED790.2(K) LED862.2(K) LED934.2(K) LED1006.2(K) LED1078.2(K) LED1150.2(K) LED1222.2(K) LED1294.2(K) LED1366.2(K) LED1438.2(K) LED1510.2(K) LED1582.2(K) LED1654.2(K) LED1726.2(K) ; port COLUMN_69  [a separate net that carries the same name]
COLUMN_70: U5.11(OUT6)
COLUMN_70: LED71.2(K) LED143.2(K) LED215.2(K) LED287.2(K) LED359.2(K) LED431.2(K) LED503.2(K) LED575.2(K) LED647.2(K) LED719.2(K) LED791.2(K) LED863.2(K) LED935.2(K) LED1007.2(K) LED1079.2(K) LED1151.2(K) LED1223.2(K) LED1295.2(K) LED1367.2(K) LED1439.2(K) LED1511.2(K) LED1583.2(K) LED1655.2(K) LED1727.2(K) ; port COLUMN_70  [a separate net that carries the same name]
COLUMN_71: LED72.2(K) LED144.2(K) LED216.2(K) LED288.2(K) LED360.2(K) LED432.2(K) LED504.2(K) LED576.2(K) LED648.2(K) LED720.2(K) LED792.2(K) LED864.2(K) LED936.2(K) LED1008.2(K) LED1080.2(K) LED1152.2(K) LED1224.2(K) LED1296.2(K) LED1368.2(K) LED1440.2(K) LED1512.2(K) LED1584.2(K) LED1656.2(K) LED1728.2(K) U5.12(OUT7) ; port COLUMN_71
COLUMN_BLANK: U1.21(BLANK) U2.21(BLANK) U3.21(BLANK) U4.21(BLANK) U5.21(BLANK) U6.16(IO10) ; port COLUMN_BLANK
COLUMN_LATCH: U1.4(LAT) U2.4(LAT) U3.4(LAT) U4.4(LAT) U5.4(LAT) U6.21(IO7) ; port COLUMN_LATCH
D+: D1.4 U6.27(IO19) ; port D+
D-: D1.6 U6.26(IO18) ; port D-
GPIO_0: H1.1 SW1.2 U6.12(IO0)
GPIO_1: H1.2 U6.13(IO1)
IC_RX: H2.2 U6.30(RXD0)
IC_TX: H2.1 U6.31(TXD0)
MOS_0: R36.1 U7.15(Q0) ; port MOS_0
MOS_1: R37.1 U7.1(Q1) ; port MOS_1
MOS_2: R38.1 U7.2(Q2) ; port MOS_2
MOS_3: R39.1 U7.3(Q3) ; port MOS_3
MOS_4: R40.1 U7.4(Q4) ; port MOS_4
MOS_5: R41.1 U7.5(Q5) ; port MOS_5
MOS_6: R42.1 U7.6(Q6) ; port MOS_6
MOS_7: R43.1 U7.7(Q7) ; port MOS_7
MOS_8: R44.1 U8.15(Q0) ; port MOS_8
MOS_9: R45.1 U8.1(Q1) ; port MOS_9
MOS_10: R46.1 U8.2(Q2) ; port MOS_10
MOS_11: R47.1 U8.3(Q3) ; port MOS_11
MOS_12: R48.1 U8.4(Q4) ; port MOS_12
MOS_13: R49.1 U8.5(Q5) ; port MOS_13
MOS_14: R50.1 U8.6(Q6) ; port MOS_14
MOS_15: R51.1 U8.7(Q7) ; port MOS_15
MOS_16: R52.1 U9.15(Q0) ; port MOS_16
MOS_17: R53.1 U9.1(Q1) ; port MOS_17
MOS_18: R54.1 U9.2(Q2) ; port MOS_18
MOS_19: R55.1 U9.3(Q3) ; port MOS_19
MOS_20: R56.1 U9.4(Q4) ; port MOS_20
MOS_21: R57.1 U9.5(Q5) ; port MOS_21
MOS_22: R58.1 U9.6(Q6) ; port MOS_22
MOS_23: R59.1 U9.7(Q7) ; port MOS_23
R_MOSI_OUT_1: U7.9(Q7S) U8.14(DS) ; port R_MOSI_OUT_1
R_MOSI_OUT_2: U8.9(Q7S) U9.14(DS) ; port R_MOSI_OUT_2
ROW_0: LED1.1(A) LED2.1(A) LED3.1(A) LED4.1(A) LED5.1(A) LED6.1(A) LED7.1(A) LED8.1(A) LED9.1(A) LED10.1(A) LED11.1(A) LED12.1(A) LED13.1(A) LED14.1(A) LED15.1(A) LED16.1(A) LED17.1(A) LED18.1(A) LED19.1(A) LED20.1(A) LED21.1(A) LED22.1(A) LED23.1(A) LED24.1(A) LED25.1(A) LED26.1(A) LED27.1(A) LED28.1(A) LED29.1(A) LED30.1(A) LED31.1(A) LED32.1(A) LED33.1(A) LED34.1(A) LED35.1(A) LED36.1(A) LED37.1(A) LED38.1(A) LED39.1(A) LED40.1(A) LED41.1(A) LED42.1(A) LED43.1(A) LED44.1(A) LED45.1(A) LED46.1(A) LED47.1(A) LED48.1(A) LED49.1(A) LED50.1(A) LED51.1(A) LED52.1(A) LED53.1(A) LED54.1(A) LED55.1(A) LED56.1(A) LED57.1(A) LED58.1(A) LED59.1(A) LED60.1(A) LED61.1(A) LED62.1(A) LED63.1(A) LED64.1(A) LED65.1(A) LED66.1(A) LED67.1(A) LED68.1(A) LED69.1(A) LED70.1(A) LED71.1(A) LED72.1(A) Q2.3(D) ; port ROW_0
ROW_1: LED73.1(A) LED74.1(A) LED75.1(A) LED76.1(A) LED77.1(A) LED78.1(A) LED79.1(A) LED80.1(A) LED81.1(A) LED82.1(A) LED83.1(A) LED84.1(A) LED85.1(A) LED86.1(A) LED87.1(A) LED88.1(A) LED89.1(A) LED90.1(A) LED91.1(A) LED92.1(A) LED93.1(A) LED94.1(A) LED95.1(A) LED96.1(A) LED97.1(A) LED98.1(A) LED99.1(A) LED100.1(A) LED101.1(A) LED102.1(A) LED103.1(A) LED104.1(A) LED105.1(A) LED106.1(A) LED107.1(A) LED108.1(A) LED109.1(A) LED110.1(A) LED111.1(A) LED112.1(A) LED113.1(A) LED114.1(A) LED115.1(A) LED116.1(A) LED117.1(A) LED118.1(A) LED119.1(A) LED120.1(A) LED121.1(A) LED122.1(A) LED123.1(A) LED124.1(A) LED125.1(A) LED126.1(A) LED127.1(A) LED128.1(A) LED129.1(A) LED130.1(A) LED131.1(A) LED132.1(A) LED133.1(A) LED134.1(A) LED135.1(A) LED136.1(A) LED137.1(A) LED138.1(A) LED139.1(A) LED140.1(A) LED141.1(A) LED142.1(A) LED143.1(A) LED144.1(A) Q3.3(D) ; port ROW_1
ROW_2: LED145.1(A) LED146.1(A) LED147.1(A) LED148.1(A) LED149.1(A) LED150.1(A) LED151.1(A) LED152.1(A) LED153.1(A) LED154.1(A) LED155.1(A) LED156.1(A) LED157.1(A) LED158.1(A) LED159.1(A) LED160.1(A) LED161.1(A) LED162.1(A) LED163.1(A) LED164.1(A) LED165.1(A) LED166.1(A) LED167.1(A) LED168.1(A) LED169.1(A) LED170.1(A) LED171.1(A) LED172.1(A) LED173.1(A) LED174.1(A) LED175.1(A) LED176.1(A) LED177.1(A) LED178.1(A) LED179.1(A) LED180.1(A) LED181.1(A) LED182.1(A) LED183.1(A) LED184.1(A) LED185.1(A) LED186.1(A) LED187.1(A) LED188.1(A) LED189.1(A) LED190.1(A) LED191.1(A) LED192.1(A) LED193.1(A) LED194.1(A) LED195.1(A) LED196.1(A) LED197.1(A) LED198.1(A) LED199.1(A) LED200.1(A) LED201.1(A) LED202.1(A) LED203.1(A) LED204.1(A) LED205.1(A) LED206.1(A) LED207.1(A) LED208.1(A) LED209.1(A) LED210.1(A) LED211.1(A) LED212.1(A) LED213.1(A) LED214.1(A) LED215.1(A) LED216.1(A) Q4.3(D) ; port ROW_2
ROW_3: LED217.1(A) LED218.1(A) LED219.1(A) LED220.1(A) LED221.1(A) LED222.1(A) LED223.1(A) LED224.1(A) LED225.1(A) LED226.1(A) LED227.1(A) LED228.1(A) LED229.1(A) LED230.1(A) LED231.1(A) LED232.1(A) LED233.1(A) LED234.1(A) LED235.1(A) LED236.1(A) LED237.1(A) LED238.1(A) LED239.1(A) LED240.1(A) LED241.1(A) LED242.1(A) LED243.1(A) LED244.1(A) LED245.1(A) LED246.1(A) LED247.1(A) LED248.1(A) LED249.1(A) LED250.1(A) LED251.1(A) LED252.1(A) LED253.1(A) LED254.1(A) LED255.1(A) LED256.1(A) LED257.1(A) LED258.1(A) LED259.1(A) LED260.1(A) LED261.1(A) LED262.1(A) LED263.1(A) LED264.1(A) LED265.1(A) LED266.1(A) LED267.1(A) LED268.1(A) LED269.1(A) LED270.1(A) LED271.1(A) LED272.1(A) LED273.1(A) LED274.1(A) LED275.1(A) LED276.1(A) LED277.1(A) LED278.1(A) LED279.1(A) LED280.1(A) LED281.1(A) LED282.1(A) LED283.1(A) LED284.1(A) LED285.1(A) LED286.1(A) LED287.1(A) LED288.1(A) Q5.3(D) ; port ROW_3
ROW_4: LED289.1(A) LED290.1(A) LED291.1(A) LED292.1(A) LED293.1(A) LED294.1(A) LED295.1(A) LED296.1(A) LED297.1(A) LED298.1(A) LED299.1(A) LED300.1(A) LED301.1(A) LED302.1(A) LED303.1(A) LED304.1(A) LED305.1(A) LED306.1(A) LED307.1(A) LED308.1(A) LED309.1(A) LED310.1(A) LED311.1(A) LED312.1(A) LED313.1(A) LED314.1(A) LED315.1(A) LED316.1(A) LED317.1(A) LED318.1(A) LED319.1(A) LED320.1(A) LED321.1(A) LED322.1(A) LED323.1(A) LED324.1(A) LED325.1(A) LED326.1(A) LED327.1(A) LED328.1(A) LED329.1(A) LED330.1(A) LED331.1(A) LED332.1(A) LED333.1(A) LED334.1(A) LED335.1(A) LED336.1(A) LED337.1(A) LED338.1(A) LED339.1(A) LED340.1(A) LED341.1(A) LED342.1(A) LED343.1(A) LED344.1(A) LED345.1(A) LED346.1(A) LED347.1(A) LED348.1(A) LED349.1(A) LED350.1(A) LED351.1(A) LED352.1(A) LED353.1(A) LED354.1(A) LED355.1(A) LED356.1(A) LED357.1(A) LED358.1(A) LED359.1(A) LED360.1(A) Q6.3(D) ; port ROW_4
ROW_5: LED361.1(A) LED362.1(A) LED363.1(A) LED364.1(A) LED365.1(A) LED366.1(A) LED367.1(A) LED368.1(A) LED369.1(A) LED370.1(A) LED371.1(A) LED372.1(A) LED373.1(A) LED374.1(A) LED375.1(A) LED376.1(A) LED377.1(A) LED378.1(A) LED379.1(A) LED380.1(A) LED381.1(A) LED382.1(A) LED383.1(A) LED384.1(A) LED385.1(A) LED386.1(A) LED387.1(A) LED388.1(A) LED389.1(A) LED390.1(A) LED391.1(A) LED392.1(A) LED393.1(A) LED394.1(A) LED395.1(A) LED396.1(A) LED397.1(A) LED398.1(A) LED399.1(A) LED400.1(A) LED401.1(A) LED402.1(A) LED403.1(A) LED404.1(A) LED405.1(A) LED406.1(A) LED407.1(A) LED408.1(A) LED409.1(A) LED410.1(A) LED411.1(A) LED412.1(A) LED413.1(A) LED414.1(A) LED415.1(A) LED416.1(A) LED417.1(A) LED418.1(A) LED419.1(A) LED420.1(A) LED421.1(A) LED422.1(A) LED423.1(A) LED424.1(A) LED425.1(A) LED426.1(A) LED427.1(A) LED428.1(A) LED429.1(A) LED430.1(A) LED431.1(A) LED432.1(A) Q7.3(D) ; port ROW_5
ROW_6: LED433.1(A) LED434.1(A) LED435.1(A) LED436.1(A) LED437.1(A) LED438.1(A) LED439.1(A) LED440.1(A) LED441.1(A) LED442.1(A) LED443.1(A) LED444.1(A) LED445.1(A) LED446.1(A) LED447.1(A) LED448.1(A) LED449.1(A) LED450.1(A) LED451.1(A) LED452.1(A) LED453.1(A) LED454.1(A) LED455.1(A) LED456.1(A) LED457.1(A) LED458.1(A) LED459.1(A) LED460.1(A) LED461.1(A) LED462.1(A) LED463.1(A) LED464.1(A) LED465.1(A) LED466.1(A) LED467.1(A) LED468.1(A) LED469.1(A) LED470.1(A) LED471.1(A) LED472.1(A) LED473.1(A) LED474.1(A) LED475.1(A) LED476.1(A) LED477.1(A) LED478.1(A) LED479.1(A) LED480.1(A) LED481.1(A) LED482.1(A) LED483.1(A) LED484.1(A) LED485.1(A) LED486.1(A) LED487.1(A) LED488.1(A) LED489.1(A) LED490.1(A) LED491.1(A) LED492.1(A) LED493.1(A) LED494.1(A) LED495.1(A) LED496.1(A) LED497.1(A) LED498.1(A) LED499.1(A) LED500.1(A) LED501.1(A) LED502.1(A) LED503.1(A) LED504.1(A) Q8.3(D) ; port ROW_6
ROW_7: LED505.1(A) LED506.1(A) LED507.1(A) LED508.1(A) LED509.1(A) LED510.1(A) LED511.1(A) LED512.1(A) LED513.1(A) LED514.1(A) LED515.1(A) LED516.1(A) LED517.1(A) LED518.1(A) LED519.1(A) LED520.1(A) LED521.1(A) LED522.1(A) LED523.1(A) LED524.1(A) LED525.1(A) LED526.1(A) LED527.1(A) LED528.1(A) LED529.1(A) LED530.1(A) LED531.1(A) LED532.1(A) LED533.1(A) LED534.1(A) LED535.1(A) LED536.1(A) LED537.1(A) LED538.1(A) LED539.1(A) LED540.1(A) LED541.1(A) LED542.1(A) LED543.1(A) LED544.1(A) LED545.1(A) LED546.1(A) LED547.1(A) LED548.1(A) LED549.1(A) LED550.1(A) LED551.1(A) LED552.1(A) LED553.1(A) LED554.1(A) LED555.1(A) LED556.1(A) LED557.1(A) LED558.1(A) LED559.1(A) LED560.1(A) LED561.1(A) LED562.1(A) LED563.1(A) LED564.1(A) LED565.1(A) LED566.1(A) LED567.1(A) LED568.1(A) LED569.1(A) LED570.1(A) LED571.1(A) LED572.1(A) LED573.1(A) LED574.1(A) LED575.1(A) LED576.1(A) Q9.3(D) ; port ROW_7
ROW_8: LED577.1(A) LED578.1(A) LED579.1(A) LED580.1(A) LED581.1(A) LED582.1(A) LED583.1(A) LED584.1(A) LED585.1(A) LED586.1(A) LED587.1(A) LED588.1(A) LED589.1(A) LED590.1(A) LED591.1(A) LED592.1(A) LED593.1(A) LED594.1(A) LED595.1(A) LED596.1(A) LED597.1(A) LED598.1(A) LED599.1(A) LED600.1(A) LED601.1(A) LED602.1(A) LED603.1(A) LED604.1(A) LED605.1(A) LED606.1(A) LED607.1(A) LED608.1(A) LED609.1(A) LED610.1(A) LED611.1(A) LED612.1(A) LED613.1(A) LED614.1(A) LED615.1(A) LED616.1(A) LED617.1(A) LED618.1(A) LED619.1(A) LED620.1(A) LED621.1(A) LED622.1(A) LED623.1(A) LED624.1(A) LED625.1(A) LED626.1(A) LED627.1(A) LED628.1(A) LED629.1(A) LED630.1(A) LED631.1(A) LED632.1(A) LED633.1(A) LED634.1(A) LED635.1(A) LED636.1(A) LED637.1(A) LED638.1(A) LED639.1(A) LED640.1(A) LED641.1(A) LED642.1(A) LED643.1(A) LED644.1(A) LED645.1(A) LED646.1(A) LED647.1(A) LED648.1(A) Q10.3(D) ; port ROW_8
ROW_9: LED649.1(A) LED650.1(A) LED651.1(A) LED652.1(A) LED653.1(A) LED654.1(A) LED655.1(A) LED656.1(A) LED657.1(A) LED658.1(A) LED659.1(A) LED660.1(A) LED661.1(A) LED662.1(A) LED663.1(A) LED664.1(A) LED665.1(A) LED666.1(A) LED667.1(A) LED668.1(A) LED669.1(A) LED670.1(A) LED671.1(A) LED672.1(A) LED673.1(A) LED674.1(A) LED675.1(A) LED676.1(A) LED677.1(A) LED678.1(A) LED679.1(A) LED680.1(A) LED681.1(A) LED682.1(A) LED683.1(A) LED684.1(A) LED685.1(A) LED686.1(A) LED687.1(A) LED688.1(A) LED689.1(A) LED690.1(A) LED691.1(A) LED692.1(A) LED693.1(A) LED694.1(A) LED695.1(A) LED696.1(A) LED697.1(A) LED698.1(A) LED699.1(A) LED700.1(A) LED701.1(A) LED702.1(A) LED703.1(A) LED704.1(A) LED705.1(A) LED706.1(A) LED707.1(A) LED708.1(A) LED709.1(A) LED710.1(A) LED711.1(A) LED712.1(A) LED713.1(A) LED714.1(A) LED715.1(A) LED716.1(A) LED717.1(A) LED718.1(A) LED719.1(A) LED720.1(A) Q11.3(D) ; port ROW_9
ROW_10: LED721.1(A) LED722.1(A) LED723.1(A) LED724.1(A) LED725.1(A) LED726.1(A) LED727.1(A) LED728.1(A) LED729.1(A) LED730.1(A) LED731.1(A) LED732.1(A) LED733.1(A) LED734.1(A) LED735.1(A) LED736.1(A) LED737.1(A) LED738.1(A) LED739.1(A) LED740.1(A) LED741.1(A) LED742.1(A) LED743.1(A) LED744.1(A) LED745.1(A) LED746.1(A) LED747.1(A) LED748.1(A) LED749.1(A) LED750.1(A) LED751.1(A) LED752.1(A) LED753.1(A) LED754.1(A) LED755.1(A) LED756.1(A) LED757.1(A) LED758.1(A) LED759.1(A) LED760.1(A) LED761.1(A) LED762.1(A) LED763.1(A) LED764.1(A) LED765.1(A) LED766.1(A) LED767.1(A) LED768.1(A) LED769.1(A) LED770.1(A) LED771.1(A) LED772.1(A) LED773.1(A) LED774.1(A) LED775.1(A) LED776.1(A) LED777.1(A) LED778.1(A) LED779.1(A) LED780.1(A) LED781.1(A) LED782.1(A) LED783.1(A) LED784.1(A) LED785.1(A) LED786.1(A) LED787.1(A) LED788.1(A) LED789.1(A) LED790.1(A) LED791.1(A) LED792.1(A) Q12.3(D) ; port ROW_10
ROW_11: LED793.1(A) LED794.1(A) LED795.1(A) LED796.1(A) LED797.1(A) LED798.1(A) LED799.1(A) LED800.1(A) LED801.1(A) LED802.1(A) LED803.1(A) LED804.1(A) LED805.1(A) LED806.1(A) LED807.1(A) LED808.1(A) LED809.1(A) LED810.1(A) LED811.1(A) LED812.1(A) LED813.1(A) LED814.1(A) LED815.1(A) LED816.1(A) LED817.1(A) LED818.1(A) LED819.1(A) LED820.1(A) LED821.1(A) LED822.1(A) LED823.1(A) LED824.1(A) LED825.1(A) LED826.1(A) LED827.1(A) LED828.1(A) LED829.1(A) LED830.1(A) LED831.1(A) LED832.1(A) LED833.1(A) LED834.1(A) LED835.1(A) LED836.1(A) LED837.1(A) LED838.1(A) LED839.1(A) LED840.1(A) LED841.1(A) LED842.1(A) LED843.1(A) LED844.1(A) LED845.1(A) LED846.1(A) LED847.1(A) LED848.1(A) LED849.1(A) LED850.1(A) LED851.1(A) LED852.1(A) LED853.1(A) LED854.1(A) LED855.1(A) LED856.1(A) LED857.1(A) LED858.1(A) LED859.1(A) LED860.1(A) LED861.1(A) LED862.1(A) LED863.1(A) LED864.1(A) Q13.3(D) ; port ROW_11
ROW_12: LED865.1(A) LED866.1(A) LED867.1(A) LED868.1(A) LED869.1(A) LED870.1(A) LED871.1(A) LED872.1(A) LED873.1(A) LED874.1(A) LED875.1(A) LED876.1(A) LED877.1(A) LED878.1(A) LED879.1(A) LED880.1(A) LED881.1(A) LED882.1(A) LED883.1(A) LED884.1(A) LED885.1(A) LED886.1(A) LED887.1(A) LED888.1(A) LED889.1(A) LED890.1(A) LED891.1(A) LED892.1(A) LED893.1(A) LED894.1(A) LED895.1(A) LED896.1(A) LED897.1(A) LED898.1(A) LED899.1(A) LED900.1(A) LED901.1(A) LED902.1(A) LED903.1(A) LED904.1(A) LED905.1(A) LED906.1(A) LED907.1(A) LED908.1(A) LED909.1(A) LED910.1(A) LED911.1(A) LED912.1(A) LED913.1(A) LED914.1(A) LED915.1(A) LED916.1(A) LED917.1(A) LED918.1(A) LED919.1(A) LED920.1(A) LED921.1(A) LED922.1(A) LED923.1(A) LED924.1(A) LED925.1(A) LED926.1(A) LED927.1(A) LED928.1(A) LED929.1(A) LED930.1(A) LED931.1(A) LED932.1(A) LED933.1(A) LED934.1(A) LED935.1(A) LED936.1(A) Q14.3(D) ; port ROW_12
ROW_13: LED937.1(A) LED938.1(A) LED939.1(A) LED940.1(A) LED941.1(A) LED942.1(A) LED943.1(A) LED944.1(A) LED945.1(A) LED946.1(A) LED947.1(A) LED948.1(A) LED949.1(A) LED950.1(A) LED951.1(A) LED952.1(A) LED953.1(A) LED954.1(A) LED955.1(A) LED956.1(A) LED957.1(A) LED958.1(A) LED959.1(A) LED960.1(A) LED961.1(A) LED962.1(A) LED963.1(A) LED964.1(A) LED965.1(A) LED966.1(A) LED967.1(A) LED968.1(A) LED969.1(A) LED970.1(A) LED971.1(A) LED972.1(A) LED973.1(A) LED974.1(A) LED975.1(A) LED976.1(A) LED977.1(A) LED978.1(A) LED979.1(A) LED980.1(A) LED981.1(A) LED982.1(A) LED983.1(A) LED984.1(A) LED985.1(A) LED986.1(A) LED987.1(A) LED988.1(A) LED989.1(A) LED990.1(A) LED991.1(A) LED992.1(A) LED993.1(A) LED994.1(A) LED995.1(A) LED996.1(A) LED997.1(A) LED998.1(A) LED999.1(A) LED1000.1(A) LED1001.1(A) LED1002.1(A) LED1003.1(A) LED1004.1(A) LED1005.1(A) LED1006.1(A) LED1007.1(A) LED1008.1(A) Q15.3(D) ; port ROW_13
ROW_14: LED1009.1(A) LED1010.1(A) LED1011.1(A) LED1012.1(A) LED1013.1(A) LED1014.1(A) LED1015.1(A) LED1016.1(A) LED1017.1(A) LED1018.1(A) LED1019.1(A) LED1020.1(A) LED1021.1(A) LED1022.1(A) LED1023.1(A) LED1024.1(A) LED1025.1(A) LED1026.1(A) LED1027.1(A) LED1028.1(A) LED1029.1(A) LED1030.1(A) LED1031.1(A) LED1032.1(A) LED1033.1(A) LED1034.1(A) LED1035.1(A) LED1036.1(A) LED1037.1(A) LED1038.1(A) LED1039.1(A) LED1040.1(A) LED1041.1(A) LED1042.1(A) LED1043.1(A) LED1044.1(A) LED1045.1(A) LED1046.1(A) LED1047.1(A) LED1048.1(A) LED1049.1(A) LED1050.1(A) LED1051.1(A) LED1052.1(A) LED1053.1(A) LED1054.1(A) LED1055.1(A) LED1056.1(A) LED1057.1(A) LED1058.1(A) LED1059.1(A) LED1060.1(A) LED1061.1(A) LED1062.1(A) LED1063.1(A) LED1064.1(A) LED1065.1(A) LED1066.1(A) LED1067.1(A) LED1068.1(A) LED1069.1(A) LED1070.1(A) LED1071.1(A) LED1072.1(A) LED1073.1(A) LED1074.1(A) LED1075.1(A) LED1076.1(A) LED1077.1(A) LED1078.1(A) LED1079.1(A) LED1080.1(A) Q16.3(D) ; port ROW_14
ROW_15: LED1081.1(A) LED1082.1(A) LED1083.1(A) LED1084.1(A) LED1085.1(A) LED1086.1(A) LED1087.1(A) LED1088.1(A) LED1089.1(A) LED1090.1(A) LED1091.1(A) LED1092.1(A) LED1093.1(A) LED1094.1(A) LED1095.1(A) LED1096.1(A) LED1097.1(A) LED1098.1(A) LED1099.1(A) LED1100.1(A) LED1101.1(A) LED1102.1(A) LED1103.1(A) LED1104.1(A) LED1105.1(A) LED1106.1(A) LED1107.1(A) LED1108.1(A) LED1109.1(A) LED1110.1(A) LED1111.1(A) LED1112.1(A) LED1113.1(A) LED1114.1(A) LED1115.1(A) LED1116.1(A) LED1117.1(A) LED1118.1(A) LED1119.1(A) LED1120.1(A) LED1121.1(A) LED1122.1(A) LED1123.1(A) LED1124.1(A) LED1125.1(A) LED1126.1(A) LED1127.1(A) LED1128.1(A) LED1129.1(A) LED1130.1(A) LED1131.1(A) LED1132.1(A) LED1133.1(A) LED1134.1(A) LED1135.1(A) LED1136.1(A) LED1137.1(A) LED1138.1(A) LED1139.1(A) LED1140.1(A) LED1141.1(A) LED1142.1(A) LED1143.1(A) LED1144.1(A) LED1145.1(A) LED1146.1(A) LED1147.1(A) LED1148.1(A) LED1149.1(A) LED1150.1(A) LED1151.1(A) LED1152.1(A) Q17.3(D) ; port ROW_15
ROW_16: LED1153.1(A) LED1154.1(A) LED1155.1(A) LED1156.1(A) LED1157.1(A) LED1158.1(A) LED1159.1(A) LED1160.1(A) LED1161.1(A) LED1162.1(A) LED1163.1(A) LED1164.1(A) LED1165.1(A) LED1166.1(A) LED1167.1(A) LED1168.1(A) LED1169.1(A) LED1170.1(A) LED1171.1(A) LED1172.1(A) LED1173.1(A) LED1174.1(A) LED1175.1(A) LED1176.1(A) LED1177.1(A) LED1178.1(A) LED1179.1(A) LED1180.1(A) LED1181.1(A) LED1182.1(A) LED1183.1(A) LED1184.1(A) LED1185.1(A) LED1186.1(A) LED1187.1(A) LED1188.1(A) LED1189.1(A) LED1190.1(A) LED1191.1(A) LED1192.1(A) LED1193.1(A) LED1194.1(A) LED1195.1(A) LED1196.1(A) LED1197.1(A) LED1198.1(A) LED1199.1(A) LED1200.1(A) LED1201.1(A) LED1202.1(A) LED1203.1(A) LED1204.1(A) LED1205.1(A) LED1206.1(A) LED1207.1(A) LED1208.1(A) LED1209.1(A) LED1210.1(A) LED1211.1(A) LED1212.1(A) LED1213.1(A) LED1214.1(A) LED1215.1(A) LED1216.1(A) LED1217.1(A) LED1218.1(A) LED1219.1(A) LED1220.1(A) LED1221.1(A) LED1222.1(A) LED1223.1(A) LED1224.1(A) Q18.3(D) ; port ROW_16
ROW_17: LED1225.1(A) LED1226.1(A) LED1227.1(A) LED1228.1(A) LED1229.1(A) LED1230.1(A) LED1231.1(A) LED1232.1(A) LED1233.1(A) LED1234.1(A) LED1235.1(A) LED1236.1(A) LED1237.1(A) LED1238.1(A) LED1239.1(A) LED1240.1(A) LED1241.1(A) LED1242.1(A) LED1243.1(A) LED1244.1(A) LED1245.1(A) LED1246.1(A) LED1247.1(A) LED1248.1(A) LED1249.1(A) LED1250.1(A) LED1251.1(A) LED1252.1(A) LED1253.1(A) LED1254.1(A) LED1255.1(A) LED1256.1(A) LED1257.1(A) LED1258.1(A) LED1259.1(A) LED1260.1(A) LED1261.1(A) LED1262.1(A) LED1263.1(A) LED1264.1(A) LED1265.1(A) LED1266.1(A) LED1267.1(A) LED1268.1(A) LED1269.1(A) LED1270.1(A) LED1271.1(A) LED1272.1(A) LED1273.1(A) LED1274.1(A) LED1275.1(A) LED1276.1(A) LED1277.1(A) LED1278.1(A) LED1279.1(A) LED1280.1(A) LED1281.1(A) LED1282.1(A) LED1283.1(A) LED1284.1(A) LED1285.1(A) LED1286.1(A) LED1287.1(A) LED1288.1(A) LED1289.1(A) LED1290.1(A) LED1291.1(A) LED1292.1(A) LED1293.1(A) LED1294.1(A) LED1295.1(A) LED1296.1(A) Q19.3(D) ; port ROW_17
ROW_18: LED1297.1(A) LED1298.1(A) LED1299.1(A) LED1300.1(A) LED1301.1(A) LED1302.1(A) LED1303.1(A) LED1304.1(A) LED1305.1(A) LED1306.1(A) LED1307.1(A) LED1308.1(A) LED1309.1(A) LED1310.1(A) LED1311.1(A) LED1312.1(A) LED1313.1(A) LED1314.1(A) LED1315.1(A) LED1316.1(A) LED1317.1(A) LED1318.1(A) LED1319.1(A) LED1320.1(A) LED1321.1(A) LED1322.1(A) LED1323.1(A) LED1324.1(A) LED1325.1(A) LED1326.1(A) LED1327.1(A) LED1328.1(A) LED1329.1(A) LED1330.1(A) LED1331.1(A) LED1332.1(A) LED1333.1(A) LED1334.1(A) LED1335.1(A) LED1336.1(A) LED1337.1(A) LED1338.1(A) LED1339.1(A) LED1340.1(A) LED1341.1(A) LED1342.1(A) LED1343.1(A) LED1344.1(A) LED1345.1(A) LED1346.1(A) LED1347.1(A) LED1348.1(A) LED1349.1(A) LED1350.1(A) LED1351.1(A) LED1352.1(A) LED1353.1(A) LED1354.1(A) LED1355.1(A) LED1356.1(A) LED1357.1(A) LED1358.1(A) LED1359.1(A) LED1360.1(A) LED1361.1(A) LED1362.1(A) LED1363.1(A) LED1364.1(A) LED1365.1(A) LED1366.1(A) LED1367.1(A) LED1368.1(A) Q20.3(D) ; port ROW_18
ROW_19: LED1369.1(A) LED1370.1(A) LED1371.1(A) LED1372.1(A) LED1373.1(A) LED1374.1(A) LED1375.1(A) LED1376.1(A) LED1377.1(A) LED1378.1(A) LED1379.1(A) LED1380.1(A) LED1381.1(A) LED1382.1(A) LED1383.1(A) LED1384.1(A) LED1385.1(A) LED1386.1(A) LED1387.1(A) LED1388.1(A) LED1389.1(A) LED1390.1(A) LED1391.1(A) LED1392.1(A) LED1393.1(A) LED1394.1(A) LED1395.1(A) LED1396.1(A) LED1397.1(A) LED1398.1(A) LED1399.1(A) LED1400.1(A) LED1401.1(A) LED1402.1(A) LED1403.1(A) LED1404.1(A) LED1405.1(A) LED1406.1(A) LED1407.1(A) LED1408.1(A) LED1409.1(A) LED1410.1(A) LED1411.1(A) LED1412.1(A) LED1413.1(A) LED1414.1(A) LED1415.1(A) LED1416.1(A) LED1417.1(A) LED1418.1(A) LED1419.1(A) LED1420.1(A) LED1421.1(A) LED1422.1(A) LED1423.1(A) LED1424.1(A) LED1425.1(A) LED1426.1(A) LED1427.1(A) LED1428.1(A) LED1429.1(A) LED1430.1(A) LED1431.1(A) LED1432.1(A) LED1433.1(A) LED1434.1(A) LED1435.1(A) LED1436.1(A) LED1437.1(A) LED1438.1(A) LED1439.1(A) LED1440.1(A) Q21.3(D) ; port ROW_19